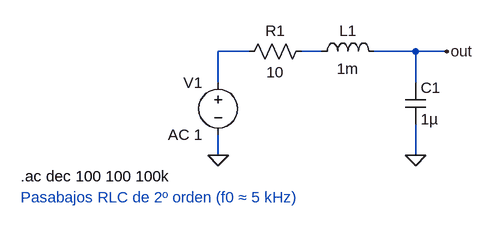
[diagram p0: schematic RLC Bode.asc]
RLC Bode.asc, the LTspice schematic file:
Version 4
SHEET 1 880 680
WIRE 0 16 0 -32
WIRE 0 -32 48 -32
WIRE 128 -32 160 -32
WIRE 240 -32 304 -32
WIRE 304 -32 352 -32
WIRE 0 96 0 128
WIRE 304 -32 304 16
WIRE 304 128 304 80
FLAG 352 -32 out
FLAG 0 128 0
FLAG 304 128 0
SYMBOL voltage 0 0 M0
WINDOW 0 24 16 Left 2
WINDOW 3 24 96 Left 2
SYMATTR InstName V1
SYMATTR Value AC 1
SYMATTR Prefix V
SYMBOL res 144 -48 R90
WINDOW 0 0 56 VBottom 2
WINDOW 3 32 56 VTop 2
SYMATTR InstName R1
SYMATTR Value 10
SYMATTR Prefix R
SYMBOL ind 144 -16 R270
WINDOW 0 32 56 VTop 2
WINDOW 3 5 56 VBottom 2
SYMATTR InstName L1
SYMATTR Value 1m
SYMATTR Prefix L
SYMBOL cap 288 16 R0
WINDOW 0 24 8 Left 2
WINDOW 3 24 56 Left 2
SYMATTR InstName C1
SYMATTR Value 1µ
SYMATTR Prefix C
TEXT -304 160 Left 2 !.ac dec 100 100 100k
TEXT -304 192 Left 2 ;Pasabajos RLC de 2º orden (f0 ≈ 5 kHz)

The netlist it stands for:
* RLC Bode.asc
V1 N001 0 AC 1
R1 N002 N001 10
L1 N002 out 1m
C1 out 0 1µ
.ac dec 100 100 100k
* Pasabajos RLC de 2º orden (f0 ≈ 5 kHz)
.backanno
.end